# Altium project 1700-0002_InterfaceBoard_RevA.PrjPcb (part 2 of 2)
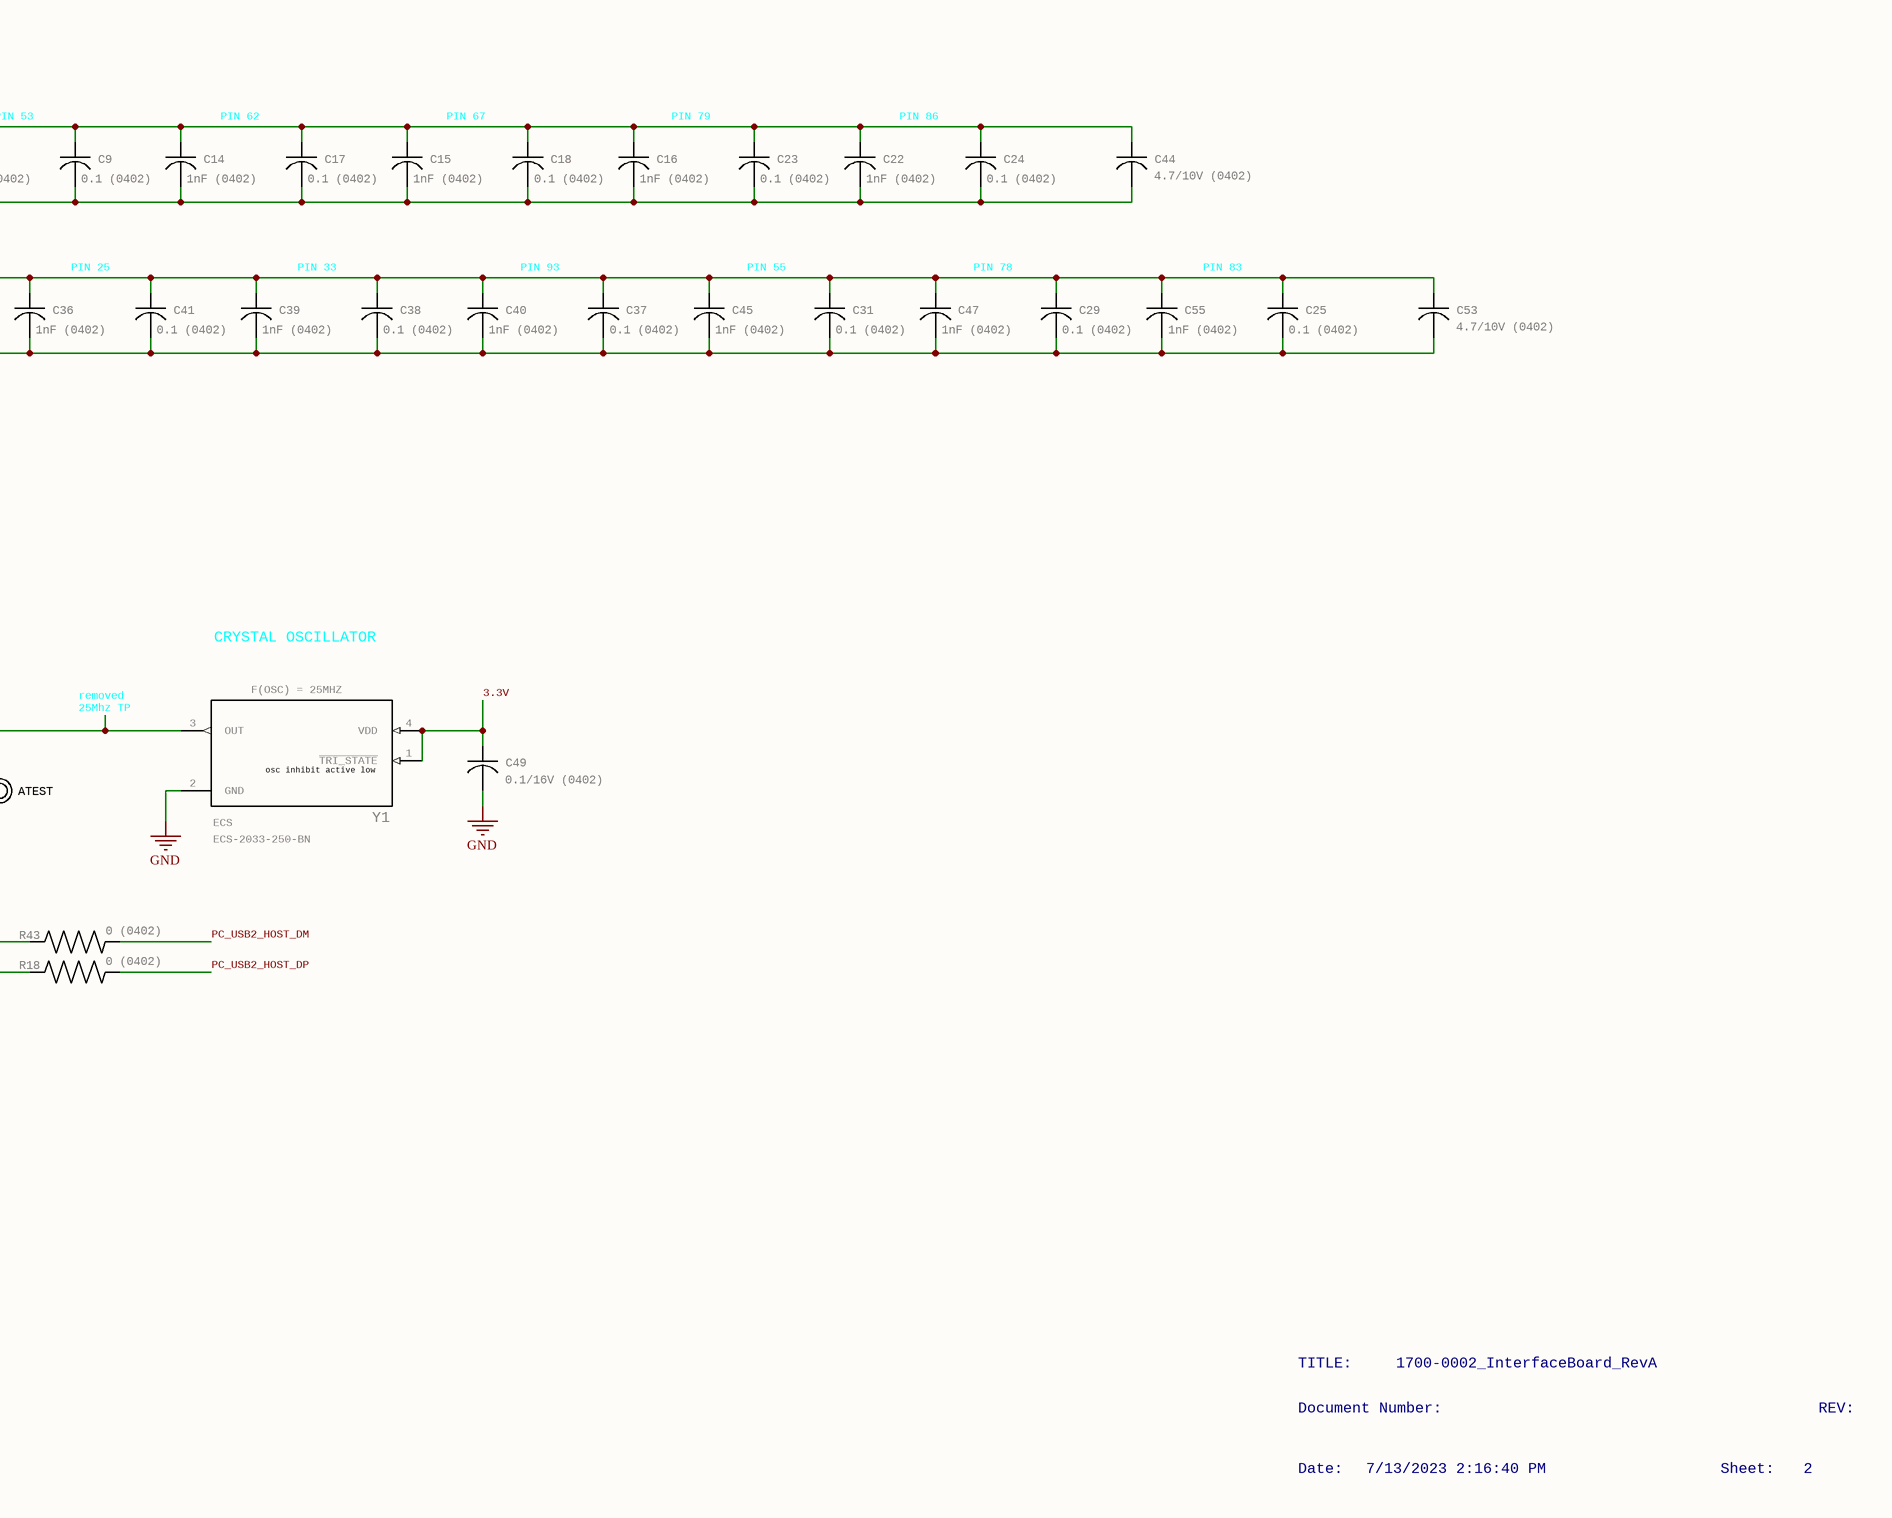
[diagram p12: 1700-0002_InterfaceBoard_RevA_1.SchDoc, bottom right]

## Nets that join several sheets
GND: 1700-0002_InterfaceBoard_RevA_0 (88 pins), 1700-0002_InterfaceBoard_RevA_1 (62 pins)
1.2V: 1700-0002_InterfaceBoard_RevA_0 (1V2.P$1 C80.1 L1.1 U2.4), 1700-0002_InterfaceBoard_RevA_1 (28 pins)
3.3V: 1700-0002_InterfaceBoard_RevA_0 (3V3.P$1 C73.1 U1.5), 1700-0002_InterfaceBoard_RevA_1 (35 pins)
3V3_EN: 1700-0002_InterfaceBoard_RevA_0 (R30.2), 1700-0002_InterfaceBoard_RevA_1 (U17.39)
5V: 1700-0002_InterfaceBoard_RevA_0 (41 pins), 1700-0002_InterfaceBoard_RevA_1 (15 pins)
5V_MB: 1700-0002_InterfaceBoard_RevA_0 (11 pins), 1700-0002_InterfaceBoard_RevA_1 (PK3.3)
ANA_EXT_TEMP: 1700-0002_InterfaceBoard_RevA_0 (J6.2 R10.1), 1700-0002_InterfaceBoard_RevA_1 (ANEXTEMP.P$1 ANEXTEMP.P$2 U17.24)
~{GNSS_PWR_EN}: 1700-0002_InterfaceBoard_RevA_0 (!GNSSPWREN.P$1 R35.1), 1700-0002_InterfaceBoard_RevA_1 (U17.22)
~{GNSS_RES}: 1700-0002_InterfaceBoard_RevA_0 (R7.1 U16.8), 1700-0002_InterfaceBoard_RevA_1 (!GNSSRES.P$1 !GNSSRES.P$2 U17.17)
~{GNSS_VBUS_EN}: 1700-0002_InterfaceBoard_RevA_0 (!GNSSVBEN.P$1 R11.1), 1700-0002_InterfaceBoard_RevA_1 (U17.15)
GNSS_ANT_DET: 1700-0002_InterfaceBoard_RevA_0 (U16.15), 1700-0002_InterfaceBoard_RevA_1 (GNSSANTDET.P$1 GNSSANTDET.P$2 U17.18)
GNSS_ANT_OK: 1700-0002_InterfaceBoard_RevA_0 (U16.16), 1700-0002_InterfaceBoard_RevA_1 (GNSSANTOK.P$1 GNSSANTOK.P$2 U17.21)
MB_PWR_EN: 1700-0002_InterfaceBoard_RevA_0 (MBPWREN.P$1 R1.1), 1700-0002_InterfaceBoard_RevA_1 (U17.30)
PC_USB2_HOST_DM: 1700-0002_InterfaceBoard_RevA_0 (J2.2 R46.2 U3.1), 1700-0002_InterfaceBoard_RevA_1 (R43.2)
PC_USB2_HOST_DP: 1700-0002_InterfaceBoard_RevA_0 (J2.3 R45.2 U3.3), 1700-0002_InterfaceBoard_RevA_1 (R18.2)
PRT_CTL1: 1700-0002_InterfaceBoard_RevA_0 (U10.1), 1700-0002_InterfaceBoard_RevA_1 (U19.60)
PRT_CTL2: 1700-0002_InterfaceBoard_RevA_0 (U11.1), 1700-0002_InterfaceBoard_RevA_1 (U19.58)
PRT_CTL3: 1700-0002_InterfaceBoard_RevA_0 (U12.1), 1700-0002_InterfaceBoard_RevA_1 (U19.59)
PRT_CTL4: 1700-0002_InterfaceBoard_RevA_0 (U13.1), 1700-0002_InterfaceBoard_RevA_1 (U19.56)
RB6(PGC)_MB: 1700-0002_InterfaceBoard_RevA_0 (J4.7), 1700-0002_InterfaceBoard_RevA_1 (PK3.9)
RB7(PGD)_MB: 1700-0002_InterfaceBoard_RevA_0 (J4.8), 1700-0002_InterfaceBoard_RevA_1 (PK3.7)
~{SPI1_SS}: 1700-0002_InterfaceBoard_RevA_0 (J1.3), 1700-0002_InterfaceBoard_RevA_1 (SS1.P$1 SS1.P$2 U17.11)
SPI1_SCK: 1700-0002_InterfaceBoard_RevA_0 (J1.6), 1700-0002_InterfaceBoard_RevA_1 (J10.3 SCK1.P$1 SCK1.P$2 U17.34)
SPI1_SDI: 1700-0002_InterfaceBoard_RevA_0 (J1.5), 1700-0002_InterfaceBoard_RevA_1 (J10.2 SDI1.P$1 SDI1.P$2 U17.35)
SPI1_SDO: 1700-0002_InterfaceBoard_RevA_0 (J1.4), 1700-0002_InterfaceBoard_RevA_1 (J10.1 SDO1.P$1 SDO1.P$2 U17.36)
TEMP_PWR_EN: 1700-0002_InterfaceBoard_RevA_0 (R41.2 TMPWREN.P$1), 1700-0002_InterfaceBoard_RevA_1 (U17.54)
UART1_RXD: 1700-0002_InterfaceBoard_RevA_0 (U6.2), 1700-0002_InterfaceBoard_RevA_1 (RXD1.P$1 RXD1.P$2 U17.32)
UART1_TXD: 1700-0002_InterfaceBoard_RevA_0 (U6.5), 1700-0002_InterfaceBoard_RevA_1 (TXD1.P$1 TXD1.P$2 U17.31)
UART2_RXD: 1700-0002_InterfaceBoard_RevA_0 (U4.5), 1700-0002_InterfaceBoard_RevA_1 (RXD2.P$2)
UART2_TXD: 1700-0002_InterfaceBoard_RevA_0 (U4.4), 1700-0002_InterfaceBoard_RevA_1 (TXD2.P$2)
USB2DN-1_DM: 1700-0002_InterfaceBoard_RevA_0 (R3.2), 1700-0002_InterfaceBoard_RevA_1 (U19.6)
USB2DN-1_DP: 1700-0002_InterfaceBoard_RevA_0 (R2.2), 1700-0002_InterfaceBoard_RevA_1 (U19.5)
USB2DN-2_DM: 1700-0002_InterfaceBoard_RevA_0 (J7.2 U7.1), 1700-0002_InterfaceBoard_RevA_1 (U19.30)
USB2DN-2_DP: 1700-0002_InterfaceBoard_RevA_0 (J7.3 U7.3), 1700-0002_InterfaceBoard_RevA_1 (U19.29)
USB2DN-3_DM: 1700-0002_InterfaceBoard_RevA_0 (J8.2 U8.1), 1700-0002_InterfaceBoard_RevA_1 (U19.15)
USB2DN-3_DP: 1700-0002_InterfaceBoard_RevA_0 (J8.3 U8.3), 1700-0002_InterfaceBoard_RevA_1 (U19.14)
USB2DN-4_DM: 1700-0002_InterfaceBoard_RevA_0 (J9.2 U9.1), 1700-0002_InterfaceBoard_RevA_1 (U19.38)
USB2DN-4_DP: 1700-0002_InterfaceBoard_RevA_0 (J9.3 U9.3), 1700-0002_InterfaceBoard_RevA_1 (U19.37)
USB3UP-A_RXDM: 1700-0002_InterfaceBoard_RevA_0 (C63.2), 1700-0002_InterfaceBoard_RevA_1 (U19.95)
USB3UP-A_RXDP: 1700-0002_InterfaceBoard_RevA_0 (C64.2), 1700-0002_InterfaceBoard_RevA_1 (U19.94)
USB3UP-A_TXDM: 1700-0002_InterfaceBoard_RevA_0 (C68.2), 1700-0002_InterfaceBoard_RevA_1 (U19.92)
USB3UP-A_TXDP: 1700-0002_InterfaceBoard_RevA_0 (C69.2), 1700-0002_InterfaceBoard_RevA_1 (U19.91)
~{VBUS1_FLT}: 1700-0002_InterfaceBoard_RevA_0 (!VB1FLT.P$1 R38.1 U10.3), 1700-0002_InterfaceBoard_RevA_1 (U17.16)
~{VBUS2_FLT}: 1700-0002_InterfaceBoard_RevA_0 (!VB2FLT.P$1 R26.1 U11.3), 1700-0002_InterfaceBoard_RevA_1 (U17.45)
~{VBUS3_FLT}: 1700-0002_InterfaceBoard_RevA_0 (!VB3FLT.P$1 R27.1 U12.3), 1700-0002_InterfaceBoard_RevA_1 (U17.53)
~{VBUS4_FLT}: 1700-0002_InterfaceBoard_RevA_0 (!VB4FLT.P$1 R28.1 U13.3), 1700-0002_InterfaceBoard_RevA_1 (U17.44)
VBUS_MON_UP: 1700-0002_InterfaceBoard_RevA_0 (R22.1 R23.2), 1700-0002_InterfaceBoard_RevA_1 (U19.80)
VPP_MB: 1700-0002_InterfaceBoard_RevA_0 (J4.2), 1700-0002_InterfaceBoard_RevA_1 (PK3.1)